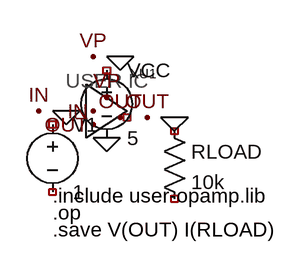
[diagram p0: schematic user-opamp.asc]
user-opamp.asc, the LTspice schematic file:
Version 4
SHEET 1 480 240
FLAG -16 0 IN
FLAG 16 0 0
FLAG 48 0 IN
FLAG 48 16 OUT
FLAG 64 -16 VP
FLAG 64 32 0
FLAG 80 8 OUT
FLAG 112 8 OUT
FLAG 144 8 0
FLAG 48 -64 VP
FLAG 80 -64 0
SYMBOL voltage 0 0 R0
SYMATTR InstName V1
SYMATTR Value 1
SYMBOL user_opamp 64 0 R0
SYMATTR InstName XU1
SYMATTR Value ELSIM_EDU_OPAMP
SYMBOL voltage 64 -64 R0
SYMATTR InstName VCC
SYMATTR Value 5
SYMBOL res 128 8 R0
SYMATTR InstName RLOAD
SYMATTR Value 10k
TEXT 0 100 Left 2 !.include user-opamp.lib
TEXT 0 120 Left 2 !.op
TEXT 0 140 Left 2 !.save V(OUT) I(RLOAD)

The netlist it stands for:
* user-opamp.asc
V1 NC_01 NC_02 1
* XU1: ELSIM_EDU_OPAMP (symbol user_opamp not certain, pin order unknown); nets seen at it: 0, IN, OUT, VP
VCC NC_04 0 5
RLOAD NC_05 NC_06 10k
.include user-opamp.lib
.op
.save V(OUT) I(RLOAD)
.backanno
.end